# Altium schematic sheet Sheet1.SchDoc
size A4; SheetNumber: 1; SheetTotal: 1
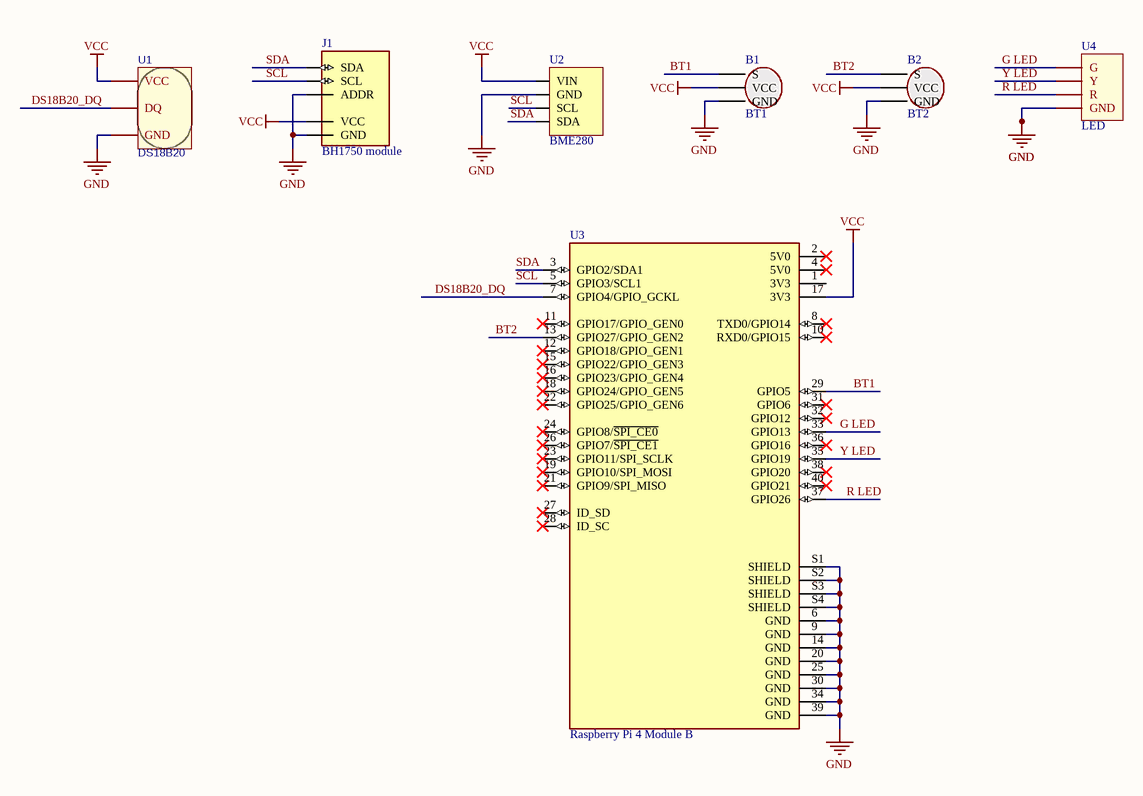
[diagram p0: Sheet1.SchDoc]

## Parts
B1  BT1  [Button KY-004]
B2  BT2  [Button KY-004]
J1  BH1750 module  [BH1750]
U1  DS18B20  [DS18B20]
U2  BME280  [BME280]
U3  Raspberry Pi 4 Module B  [Raspberry Pi 4 Module B]
U4  LED  [Traffic LED]

## Nets
GND: B1.GND B2.GND J1.ADDR J1.GND U1.GND U2.GND U3.6(GND) U3.9(GND) U3.14(GND) U3.20(GND) U3.25(GND) U3.30(GND) U3.34(GND) U3.39(GND) U3.S1(SHIELD) U3.S2(SHIELD) U3.S3(SHIELD) U3.S4(SHIELD) U4.GND
VCC: B1.VCC B2.VCC J1.VCC U1.VCC U2.VCC(VIN) U3.17(3V3)
BT1: B1.S U3.29(GPIO5)
BT2: B2.S U3.13(GPIO27/GPIO_GEN2)
DS18B20_DQ: U1.S(DQ) U3.7(GPIO4/GPIO_GCKL)
G LED: U3.33(GPIO13) U4.G
R LED: U3.37(GPIO26) U4.R
SCL: J1.SCL U2.SCL U3.5(GPIO3/SCL1)
SDA: J1.SDA U2.SDA U3.3(GPIO2/SDA1)
Y LED: U3.35(GPIO19) U4.Y

Not connected (* = marked no-connect by the designer): U3 1(3V3) 2(5V0)* 4(5V0)* 8(TXD0/GPIO14)* 10(RXD0/GPIO15)* 11(GPIO17/GPIO_GEN0)* 12(GPIO18/GPIO_GEN1)* 15(GPIO22/GPIO_GEN3)* 16(GPIO23/GPIO_GEN4)* 18(GPIO24/GPIO_GEN5)* 19(GPIO10/SPI_MOSI)* 21(GPIO9/SPI_MISO)* 22(GPIO25/GPIO_GEN6)* 23(GPIO11/SPI_SCLK)* 24(GPIO8/~{SPI_CE0})* 26(GPIO7/~{SPI_CE1})* 27(ID_SD)* 28(ID_SC)* 31(GPIO6)* 32(GPIO12)* 36(GPIO16)* 38(GPIO20)* 40(GPIO21)*

## Library data of the parts
B1 B2 = Button
J1 = BH1750 module: 1pc BH1750 Digital Ambient Light Intensity Sensor Module for Arduino GY-302; MF: YKS; MP: ZC362800#; SnapEDA_Link: https://www.snapeda.com/parts/ZC362800%23/YKS/view-part/?ref=snap; Package: None; Value: *; Check_prices: https://www.snapeda.com/parts/ZC362800%23/YKS/view-part/?ref=eda
U3 = Raspberry Pi 4 Module B: The Raspberry Pi 4 Model B SC0194(9) single board computer features a Broadcom BCM2711 ARM Cortex-A72 quad-core processor operating at 1.5GHz, making it a powerful choice for embedded computing applications. Equipped with 4GB of RAM and a variety of conne; SnapEDA_Link: https://www.snapeda.com/parts/SC0194(9)/Raspberry+Pi/view-part/?ref=snap; Package: None; Value: *; MF: Raspberry Pi; MP: SC0194(9); Check_prices: https://www.snapeda.com/parts/SC0194(9)/Raspberry+Pi/view-part/?ref=eda
U1 = DS18B20: timeStamp: 1464408497; Manufacturer Part: ?; spicePre: U; Supplier: RS-Online; Supplier Part: 540-2805